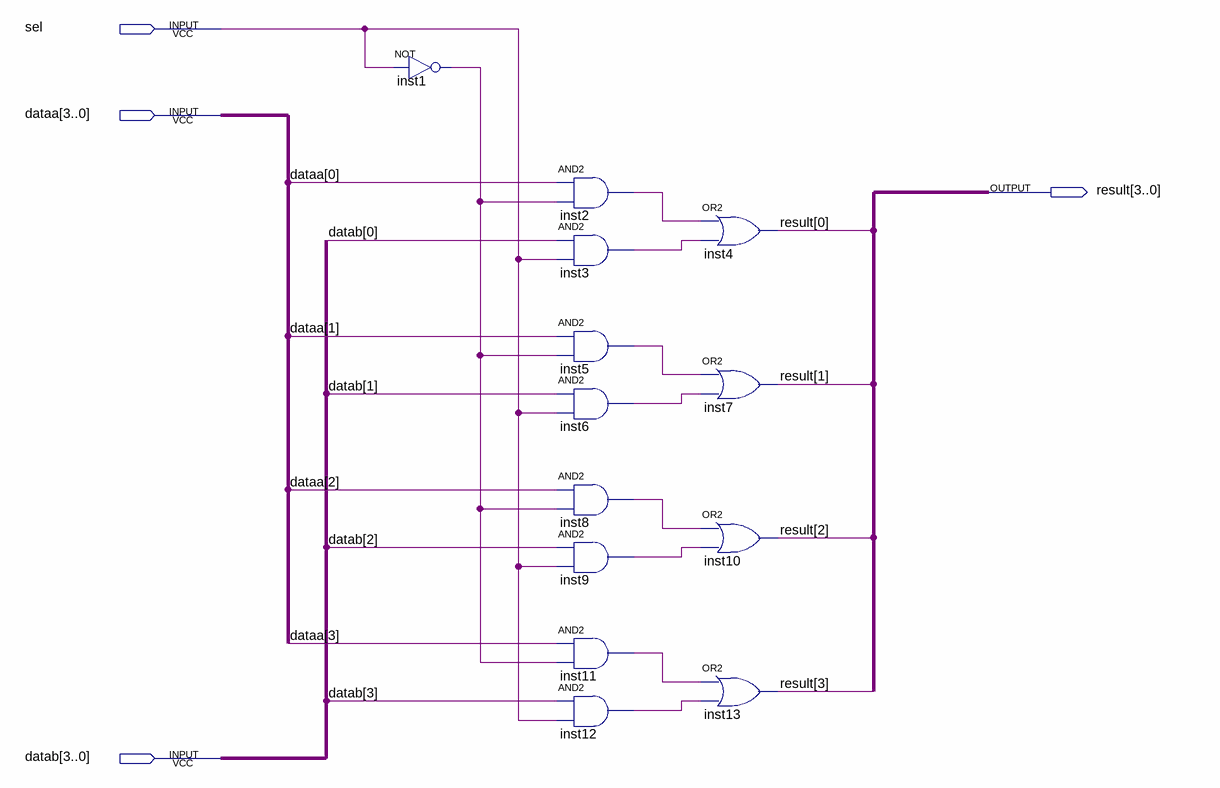
[diagram p0: schematic sheet]
// Quartus schematic mux2x4.bdf as structural Verilog: 13 symbols, 4 pins
module mux2x4 (
  input  sel,
  input  [3:0] dataa,
  input  [3:0] datab,
  output [3:0] result
);

  wire inst1_out, inst2_out, inst3_out, inst5_out, inst6_out, inst8_out, inst9_out, inst11_out, inst12_out;

  not inst1 (inst1_out, sel);
  and inst2 (inst2_out, dataa[0], inst1_out);
  and inst3 (inst3_out, datab[0], sel);
  and inst5 (inst5_out, dataa[1], inst1_out);
  and inst6 (inst6_out, datab[1], sel);
  and inst8 (inst8_out, dataa[2], inst1_out);
  and inst9 (inst9_out, datab[2], sel);
  and inst11 (inst11_out, dataa[3], inst1_out);
  and inst12 (inst12_out, datab[3], sel);
  or inst4 (result[0], inst2_out, inst3_out);
  or inst7 (result[1], inst5_out, inst6_out);
  or inst10 (result[2], inst8_out, inst9_out);
  or inst13 (result[3], inst11_out, inst12_out);
endmodule
